# Altium schematic sheet Sheet3.SchDoc
size A; SheetNumber: 3; SheetTotal: 10
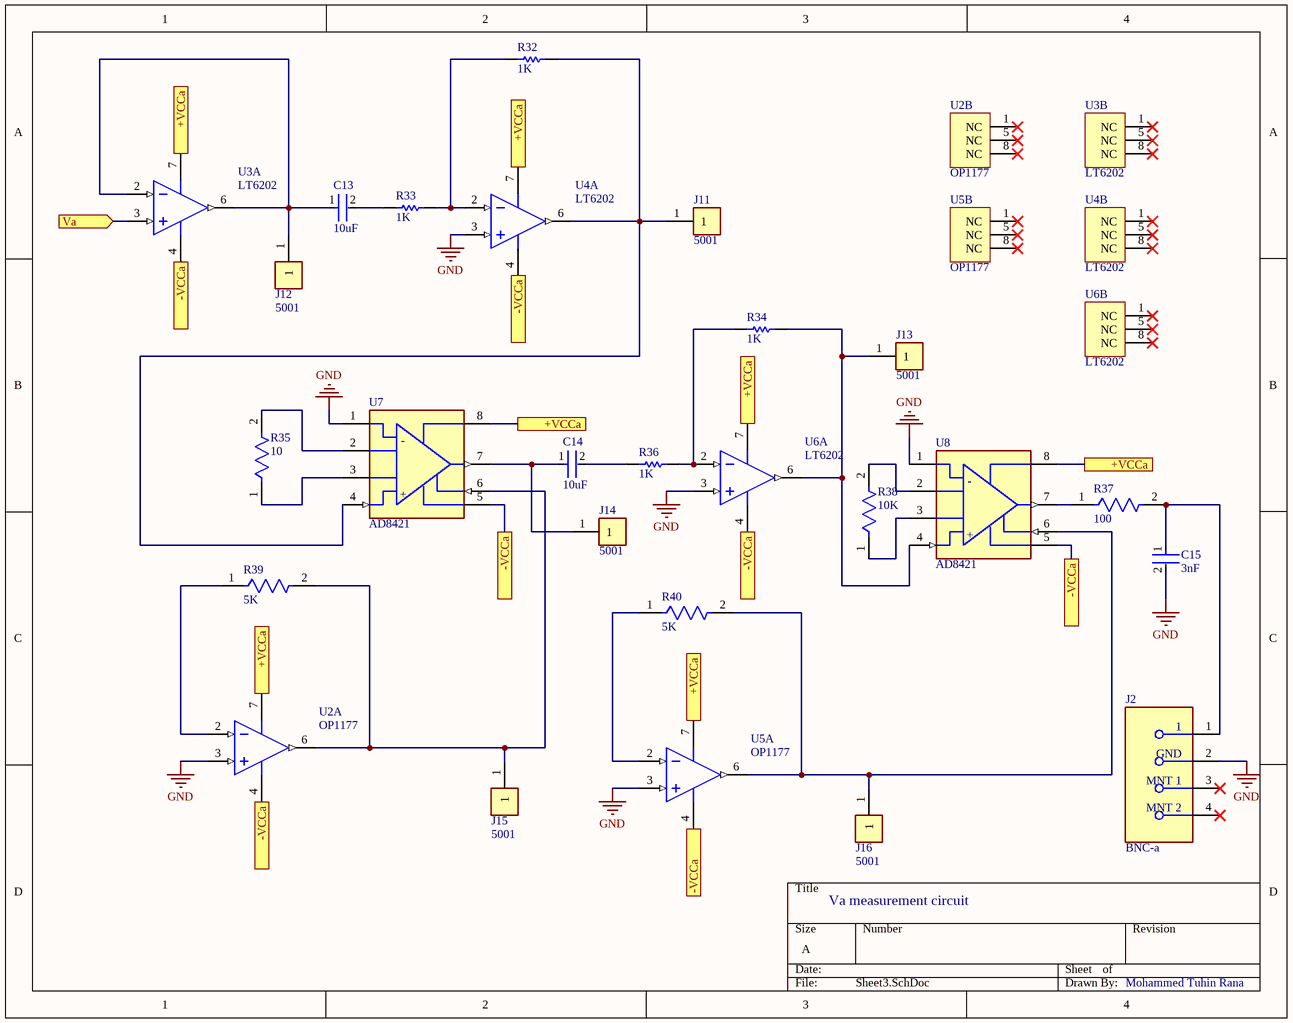
[diagram p0: Sheet3.SchDoc]

## Parts
C13  10uF  [FP-GRM21B-0_1-IPC_C]
C14  10uF  [FP-GRM21B-0_1-IPC_C]
C15  3nF  [FP-C1206C-EB-MFG]
J2  BNC-a  [FP-5413194-2-MFG]
J11  5001  [FP-5001-MFG]
J12  5001  [FP-5001-MFG]
J13  5001  [FP-5001-MFG]
J14  5001  [FP-5001-MFG]
J15  5001  [FP-5001-MFG]
J16  5001  [FP-5001-MFG]
R32  1K  [RESC3216X70X50ML20T25]
R33  1K  [RESC3216X70X50ML20T25]
R34  1K  [RESC3216X70X50ML20T25]
R35  10  [FP-RT0603-MFG]
R36  1K  [RESC3216X70X50ML20T25]
R37  100  [FP-ERA3A-IPC_B]
R38  10K  [FP-ERJPA3-IPC_A]
R39  5K  [FP-RT1206-0_65-MFG]
R40  5K  [FP-RT1206-0_65-MFG]
U2  OP1177  [ADI-R-8_N]  (parts A,B of 2)
U3  LT6202  [LT-S8-8_N]  (parts A,B of 2)
U4  LT6202  [LT-S8-8_N]  (parts A,B of 2)
U5  OP1177  [ADI-R-8_N]  (parts A,B of 2)
U6  LT6202  [LT-S8-8_N]  (parts A,B of 2)
U7  AD8421  [FP-R-8-IPC_C]
U8  AD8421  [FP-R-8-IPC_C]

## Ports
+VCCa (see Sheet3[1A], Sheet3[1C], Sheet3[2A], Sheet3[2B], Sheet3[3B], Sheet3[3C], Sheet7[4B]), +VCCa (see Sheet3[1A], Sheet3[1C], Sheet3[2A], Sheet3[2B], Sheet3[3B], Sheet3[4B], Sheet7[4B]), +VCCa (see Sheet3[1A], Sheet3[1C], Sheet3[2A], Sheet3[2B], Sheet3[3C], Sheet3[4B], Sheet7[4B]), +VCCa (see Sheet3[1A], Sheet3[1C], Sheet3[2A], Sheet3[3B], Sheet3[3C], Sheet3[4B], Sheet7[4B]), +VCCa (see Sheet3[1A], Sheet3[1C], Sheet3[2B], Sheet3[3B], Sheet3[3C], Sheet3[4B], Sheet7[4B]), +VCCa (see Sheet3[1A], Sheet3[2A], Sheet3[2B], Sheet3[3B], Sheet3[3C], Sheet3[4B], Sheet7[4B]), +VCCa (see Sheet3[1C], Sheet3[2A], Sheet3[2B], Sheet3[3B], Sheet3[3C], Sheet3[4B], Sheet7[4B]), -VCCa (see Sheet3[1B], Sheet3[1D], Sheet3[2B], Sheet3[2C], Sheet3[3C], Sheet3[3D], Sheet7[3B]), -VCCa (see Sheet3[1B], Sheet3[1D], Sheet3[2B], Sheet3[2C], Sheet3[3C], Sheet3[4C], Sheet7[3B]), -VCCa (see Sheet3[1B], Sheet3[1D], Sheet3[2B], Sheet3[2C], Sheet3[3D], Sheet3[4C], Sheet7[3B]), -VCCa (see Sheet3[1B], Sheet3[1D], Sheet3[2B], Sheet3[3C], Sheet3[3D], Sheet3[4C], Sheet7[3B]), -VCCa (see Sheet3[1B], Sheet3[1D], Sheet3[2C], Sheet3[3C], Sheet3[3D], Sheet3[4C], Sheet7[3B]), -VCCa (see Sheet3[1B], Sheet3[2B], Sheet3[2C], Sheet3[3C], Sheet3[3D], Sheet3[4C], Sheet7[3B]), -VCCa (see Sheet3[1D], Sheet3[2B], Sheet3[2C], Sheet3[3C], Sheet3[3D], Sheet3[4C], Sheet7[3B]), Va (in, see Sheet2[1B])

## Nets
GND: C15.2 J2.2(GND) U2.3(+IN) U4.3(+IN) U5.3(+IN) U6.3(+IN) U7.1(-IN) U8.1(-IN)
+VCCa: U2.7(+V) U3.7(V+) U4.7(V+) U5.7(+V) U6.7(V+) U7.8(+VS) U8.8(+VS) ; port +VCCa
-VCCa: U2.4(-V) U3.4(V-) U4.4(V-) U5.4(-V) U6.4(V-) U7.5(-VS) U8.5(-VS) ; port -VCCa
Va: U3.3(+IN) ; port Va
NetC13_1: C13.1 J12.1 U3.2(-IN) U3.6(OUT)
NetC13_2: C13.2 R33.1
NetC14_1: C14.1 J14.1 U7.7(VOUT)
NetC14_2: C14.2 R36.1
NetC15_1: C15.1 J2.1 R37.2
NetJ11_1: J11.1 R32.2 U4.6(OUT) U7.4(+IN)
NetJ13_1: J13.1 R34.2 U6.6(OUT) U8.4(+IN)
NetJ15_1: J15.1 R39.2 U2.6(OUT) U7.6(REF)
NetJ16_1: J16.1 R40.2 U5.6(OUT) U8.6(REF)
NetR32_1: R32.1 R33.2 U4.2(-IN)
NetR34_1: R34.1 R36.2 U6.2(-IN)
NetR35_1: R35.1 U7.3(2_RG)
NetR35_2: R35.2 U7.2(1_RG)
NetR37_1: R37.1 U8.7(VOUT)
NetR38_1: R38.1 U8.3(2_RG)
NetR38_2: R38.2 U8.2(1_RG)
NetR39_1: R39.1 U2.2(-IN)
NetR40_1: R40.1 U5.2(-IN)

Not connected (* = marked no-connect by the designer): J2 3(MNT_1)* 4(MNT_2)*; U2 1(NC)* 5(NC)* 8(NC)*; U3 1(NC)* 5(NC)* 8(NC)*; U4 1(NC)* 5(NC)* 8(NC)*; U5 1(NC)* 5(NC)* 8(NC)*; U6 1(NC)* 5(NC)* 8(NC)*

## Notes on the sheet
- Va measurement circuit
- Mohammed Tuhin Rana
- (in symbol CMP-09116-000012-1) -; +

## Library data of the parts
C13 C14 = CMP-2007-03453-2: Chip Multilayer Ceramic Capacitors for General Purpose, 0805, 10uF, X5R, 15%, 10%, 16V; Radiation Hardening: No; Thickness: 0.053inch; Voltage Rating (DC): 16V; Lead Free: Lead Free; Package Quantity: 1; Width: 1.25mm; Case Code (Imperial): 0805; Depth: 1.25mm; Packaging: Tape and Reel; Dielectric: X5R; Max Operating Temperature: 85°C; Tolerance: 10%; Voltage Rating: 16V; Voltage: 16V; Capacitance: 10uF; Height: 1.25mm; Case Code (Metric): 2012; Material: Ceramic; Mount: Surface Mount; Case/Package: 0805; REACH SVHC: No SVHC; Length: 2mm; Min Operating Temperature: -55°C; Termination: SMD/SMT
C15 = CMP-1037-02920-2: CAP CER 3000PF 50V NP0 1206; Manufacturer Part Number: C1206C302J5GACTU; Manufacturer: KEMET; Value: 3,000 pF; Temperature Coefficient: 15%; Tolerance: 0.05; Material: Ceramic; Automotive Grade: Grade 0; Temperature Characteristic: C0G; ComponentLink2URL: https://content.kemet.com/datasheets/KEM_C1007_X8R_ULTRA_150C_SMD.pdf; Device Class L3: Ceramic Capacitors; Device Class L2: Capacitors; ComponentLink2Description: Datasheet; Automotive: Yes; Temperature Range Low: -55°C; Temperature: -55°C to +150°C; Octopart: https://octopart.com/c1206c302j5gactu-kemet-12776246; Height: 0.88mm; Lead Free: Yes; Device Class L1: Passive Components; Digikey Description: CAP CER 3000PF 50V NP0 1206; Category: Cap; Mouser Description: Capacitor, Ceramic, 3Nf, 50Vdc, 5-% Tol, 5+% Tol, C0g-Tc Code, -30, 30Ppm-Tc Rohs Compliant: Yes; RoHS: TRUE; Ipc Land Pattern Name: CAPC320160X78; Voltage Rating: 50 V; Capacitance: 3,000 pF; Temperature Range High: +150°C; Package: C1206C-EB
J2 = CMP-03790-39547162-1: 5413194-2 RF BNC Connector, 1 Contact(s), Female, Panel Mount, Solder Terminal, Locking, Jack; Manufacturer Lifecycle Status: ACTIVE; Impedance: 75Ω; Number of Positions: 1; Outside Diameter: 14.529mm; Polarity: Normal, Standard; Sealable: No; Dielectric Material: Polymethylpentene; PCB Mounting Orientation: Right Angle; Voltage Rating: 500V; Body Plating: Nickel; Frequency: 2GHz; Tail Length: 4.11mm; Insulation Resistance: 5GΩ; Body Material: Zinc; ELV: Compliant; Lead Free: Lead Free; Radiation Hardening: No; Gender: Female; Color: Black; Mount: Panel, Through Hole; Packaging: Bulk; NexarPartId: 39547162; Housing Color: Black; Fastening Type: Bayonet; Contact Gender: Female; Lifecycle Status: Production; Depth: 34.93mm; Min Operating Temperature: -55°C; Number of Contacts: 1; RoHS: Compliant; Length: 14.76mm; Insulation Material: Polymethylpentene; Termination: Solder, Through Hole; Connector Type: BNC; Contact Plating: Gold; Max Frequency: 2GHz; Max Operating Temperature: 85°C; Height: 13.18mm; REACH SVHC: Unknown; Orientation: Right Angle; Contact Material: Copper
J11-J16 = CMP-2000-05181-2: PC TEST POINT MINIATURE BLACK; Body Material: Bronze; Plating: Silver; Inside Diameter: 1.27mm; Hole Diameter: 1.6mm; Number of Ports: 1; Outside Diameter: 2.54mm; Insulation: Insulated; Insulation Material: Nylon; Mount: Through Hole; RoHS Compliant: Yes; Series: THM; Height: 0.3inch; Termination: Through Hole; Material: Nylon; Packaging: Bulk; Contact Material: Bronze; REACH SVHC: No SVHC; Contact Plating: Silver; Orientation: Straight; Lead Free: Lead Free; Package Quantity: 100; Length: 7.62mm; Flammability Rating: UL94 V-0; Number of Contacts: 1; Diameter: 2.54mm; Housing Color: Black; Color: Black
R32-R34 R36 = CMP-2003-04406-1: Part Number: ERA8AEB102V; Manufacturer: Panasonic
R35 = CMP-2000-04347-2: RES SMD 10 OHM 0.1% 1/10W 0603; Manufacturer: Yageo; Manufacturer Part Number: RT0603BRD0710RL; Resistance: 10Ω; Temperature Coefficient: 25 ppm/°C; Power Rating: 0.1W; Tolerance: 0.001; Voltage Rating: 75V; Value: 10Ω; Height: 0.55mm; Temperature Range Low: -55°C; Temperature Range High: +155°C; Package: RT0603; Digikey Description: RES SMD 10 OHM 0.1% 1/10W 0603; Lead Free: Yes; Ipc Land Pattern Name: RESC16080X45; Mouser Description: Thin Film Resistors - SMD 1/10W 10 ohm .1% 25ppm; Automotive: No; Footprint Url: http://www.yageo.com/exep/pages/download/literatures/PYu-R_Mount_10.pdf; Series: RT; Device Class L3: Chip SMD Resistors; Device Class L2: Resistors; Octopart: https://octopart.com/rt0603brd0710rl-yageo-1216748; Temperature: -55°C to +155°C; Composition: Thin Film; Category: Res; ComponentLink2Description: Datasheet; Device Class L1: Passive Components; RoHS: TRUE; ComponentLink2URL: http://www.yageo.com/documents/recent/PYu-RT_1-to-0.01_RoHS_L_9.pdf
R37 = CMP-2000-00870-2: RES SMD 100 OHM 0.1% 1/10W 0603; Voltage Rating: 75V; Power Rating: 100mW; Resistance: 100R; Temperature Coefficient: 25ppm/°C; Number of Terminations: 2; Case/Package: 0603; Termination: SMD/SMT; Number of Pins: 2; Size Code: 0603; Length: 1.6mm; Min Operating Temperature: -55°C; Resistor Type: Thin Film; Depth: 0.8mm; Military Standard: Not; Packaging: Tape and Reel; RoHS Compliant: Yes; Construction: Rectangular; Resistance Tolerance: 0.1%; Contact Plating: Tin; Width: 0.8mm; Mount: Surface Mount; Case Code (Metric): 1608; Max Operating Temperature: 155°C; Height: 0.45mm; Case Code (Imperial): 0603; Series: ERA-3A; Package Quantity: 5000; REACH SVHC: No SVHC; Tolerance: 0.1%; Max Power Dissipation: 100mW; Radiation Hardening: No; Technology: METAL FILM
R38 = CMP-05422-000155-1: RES SMD 10K OHM 1% 1/3W 0603; RoHS Compliant: Yes
R39 R40 = CMP-03412-001731-1: RES SMD 5K OHM 0.1% 1/4W 1206; Manufacturer: Yageo; Manufacturer Part Number: RT1206BRD075KL; Resistance: 5kΩ; Value: 5kΩ; Power Rating: 0.25W; Voltage Rating: 200V; Temperature Coefficient: 25ppm/°C; Series: RT; Mouser Description: Thin Film Resistors - SMD 1/4W 5K ohm .1% 25ppm; Temperature: -55°C to +155°C; Composition: Thin Film; Footprint Url: https://www.yageo.com/upload/website/yageo_PYu-R_Mount_10_19050818_343.pdf; Device Class L1: Passive Components; Temperature Range High: +155°C; Octopart: https://octopart.com/rt1206brd075kl-yageo-29806230; Ipc Land Pattern Name: RESC310160X55; Device Class L3: Chip SMD Resistors; Temperature Range Low: -55°C; Height: 0.65mm; ComponentLink2URL: https://www.yageo.com/upload/media/product/productsearch/datasheet/rchip/PYu-RT_1-to-0.01_RoHS_L_11.pdf; Automotive: No; Category: Res; ComponentLink2Description: Datasheet; Package: RT1206-0.65; Lead Free: Yes; Digikey Description: RES SMD 5K OHM 0.1% 1/4W 1206; Device Class L2: Resistors; RoHS: TRUE; Tolerance: 0.1%
U2 U5 = CMP-0384-00640-2: Single Channel Wide Bandwidth Operational Amplifier, 1.3 MHz BW, 700 mV/us SR, Industrial, 8-pin SOIC (R-8), Reel; PartNumber: OP1177ARZ-REEL7; Manufacturer: Analog Devices; Iq/Amp: 500uA; V Span Max: 36V; Input Bias Current: 500pA; Amplifiers Per Package: 1; Small Signal Bandwidth: 1.3MHz; V Span Min: 5V; Input Offset Voltage: 15uV; ComponentLink2Description: Datasheet; ComponentLink4URL: http://www.analog.com/en/all-operational-amplifiers-op-amps/operational-amplifiers-op-amps/op1177/products/product.html#product-recommendations; ComponentLink3Description: Package Specification; PackageDescription: 8-Pin Standard Small Outline Package, Body 3.9 x 4.9 mm, Pitch 1.27 mm; ComponentLink1URL: http://www.analog.com/en/index.html; PackageReference: R-8; PackageVersion: 060506-A; DatasheetVersion: Rev. G; ComponentLink4Description: Reference Circuit; ComponentLink1Description: Manufacturer URL; Mounting Technology: Surface Mount; RevisionNote: Reference Circuit URL fixed; ComponentLink3URL: http://www.analog.com/static/imported-files/packages/PKG_PDF/SOIC_Narrow%20(R)/R_8.pdf; Code_JEDEC: MS-012-AA; Slew Rate: 700mV/us; ComponentLink2URL: http://www.analog.com/static/imported-files/data_sheets/OP1177_2177_4177.pdf; Generic Part Number: OP1177
U3 U4 U6 = CMP-0359-02644-2: Single Channel, Low Noise, High Speed Operational Amplifier, RRIO, 100 MHz Typical GBW, 25 V/us Typical SR, 2.5 to 12.6 V, 8-Pin SOIC (S8-8), Commercial, Pb-Free; Manufacturer: Linear Technology; PartNumber: LT6202CS8#PBF; Channels (#): 1; Vs Min (V): 2.5; Is (mA) Typical: 2.8; Vos (mV) Typical: 0.1; Vos (mV) Guaranteed: 0.5; GBW (MHz) Typical: 100; Vs Max (V): 12.6; SR (V/us) Typical: 25; RevisionNote: URLs updated; ComponentLink2URL: http://cds.linear.com/docs/en/datasheet/620234fd.pdf; PackageDescription: 8-Pin Plastic Small Outline, Body 4.9 x 3.9 mm, Pitch 1.27 mm; Linear Technology Part Number: LT6202; RoHS: Pb-Free; ComponentLink3Description: Package Specification; ComponentLink2Description: Datasheet; PackageVersion: Rev G; ComponentLink3URL: http://cds.linear.com/docs/en/packaging/05081610_G_SO8.pdf; ComponentLink1Description: Manufacturer URL; DatasheetVersion: Rev. D; PackageReference: LT-S8-8; Mounting Technology: Surface Mount; ComponentLink1URL: http://www.linear.com/; Type: VFB
U7 U8 = CMP-09116-000012-1: IC OPAMP INSTR 10MHZ 8SOIC; Manufacturer: Analog Devices; Manufacturer Part Number: AD8421ARZ-R7; Number Of Channels: 1; Min Supply Voltage: 5V; Max Dual Supply Voltage: 18V; Input Offset Voltage: 0.07mV; Standoff Height: 0.1mm; Min Dual Supply Voltage: 2.5V; Nominal Supply Current: 2mA; Max Supply Voltage: 36V; Input Bias Current: 0.001uA; Max Junction Temp: +150°C; Lead Free: Yes; Temperature: -40°C to +85°C; Device Class L1: Integrated Circuits (ICs); Temperature Range Low: -40°C; Automotive: No; RoHS: TRUE; Bandwidth: 10MHz; Package: R-8; Temperature Range High: +85°C; Octopart: https://octopart.com/ad8421arz-r7-analog+devices-21054779; Digikey Description: IC OPAMP INSTR 10MHZ 8SOIC; Device Class L2: Linear ICs; ComponentLink2Description: Datasheet; Category: IC; ComponentLink2URL: https://www.analog.com/media/en/technical-documentation/data-sheets/AD8421.pdf; Height: 1.75mm; Mouser Description: Instrumentation Amplifiers 3nV/Hz Low Power; Device Class L3: Instrumentation